# Altium schematic sheet Buzzer.SchDoc
size A2; SheetNumber: 9; SheetTotal: 13
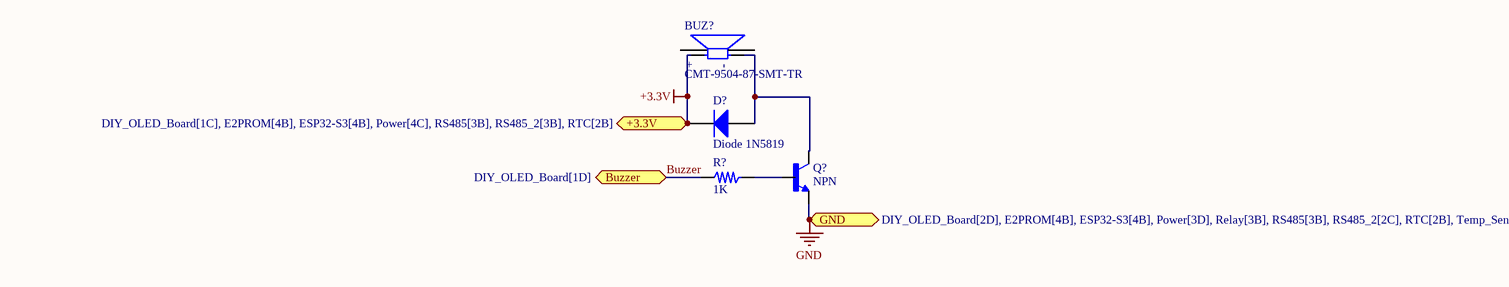
[diagram p0: Buzzer.SchDoc]

## Parts
BUZ?  CMT-9504-87-SMT-TR  [CMT-9504-87-SMT-TR]
D?  Diode 1N5819  [DO-214AA]
Q?  NPN  [MMBT2222A]
R?  1K  [R0805]

## Ports
+3.3V (bidir, see DIY_OLED_Board[1C], E2PROM[4B], ESP32-S3[4B], Power[4C], RS485[3B], RS485_2[3B], RTC[2B]), Buzzer (bidir, see DIY_OLED_Board[1D]), GND (bidir, see DIY_OLED_Board[2D], E2PROM[4B], ESP32-S3[4B], Power[3D], Relay[3B], RS485[3B], RS485_2[2C], RTC[2B], Temp_Sensor[2C], USB[2C])

## Nets
+3.3V: BUZ?.P D?.2(K) ; port +3.3V
GND: Q?.2(E) ; port GND
Buzzer: R?.1 ; port Buzzer
NetBUZ?_N: BUZ?.N D?.1(A) Q?.3(C)
NetQ?_1: Q?.1(B) R?.2

Not connected (* = marked no-connect by the designer): BUZ? 1 2

## Notes on the sheet
- (in symbol CMT-9504-87-SMT-TR) +; -

## Library data of the parts
D? = Diode 1N4148: High Conductance Fast Diode; Published: 8-Jun-2000; LatestRevisionDate: 17-Jul-2002; LatestRevisionNote: Re-released for DXP Platform.; DatasheetVersion: 1997; PackageReference: DO-35; Publisher: Altium Limited; PackageDescription: Diode, Axial; Body 3.8 x 1.9 mm (LxDia. max), Lead Dia. 0.53 mm (max); Code_JEDEC: DO-204-AH; ComponentLink1Description: Manufacturer Link; ComponentLink1URL: http://www.fairchildsemi.com/; ComponentLink2Description: Datasheet; ComponentLink2URL: http://www.fairchildsemi.com/ds/1N%2F1N4148.pdf
Q? = MMBT2222A
R? = myRes_1: Value: 1K